# Altium schematic sheet LNA_6_GHz.SchDoc
size A; SheetNumber: 1; SheetTotal: 11
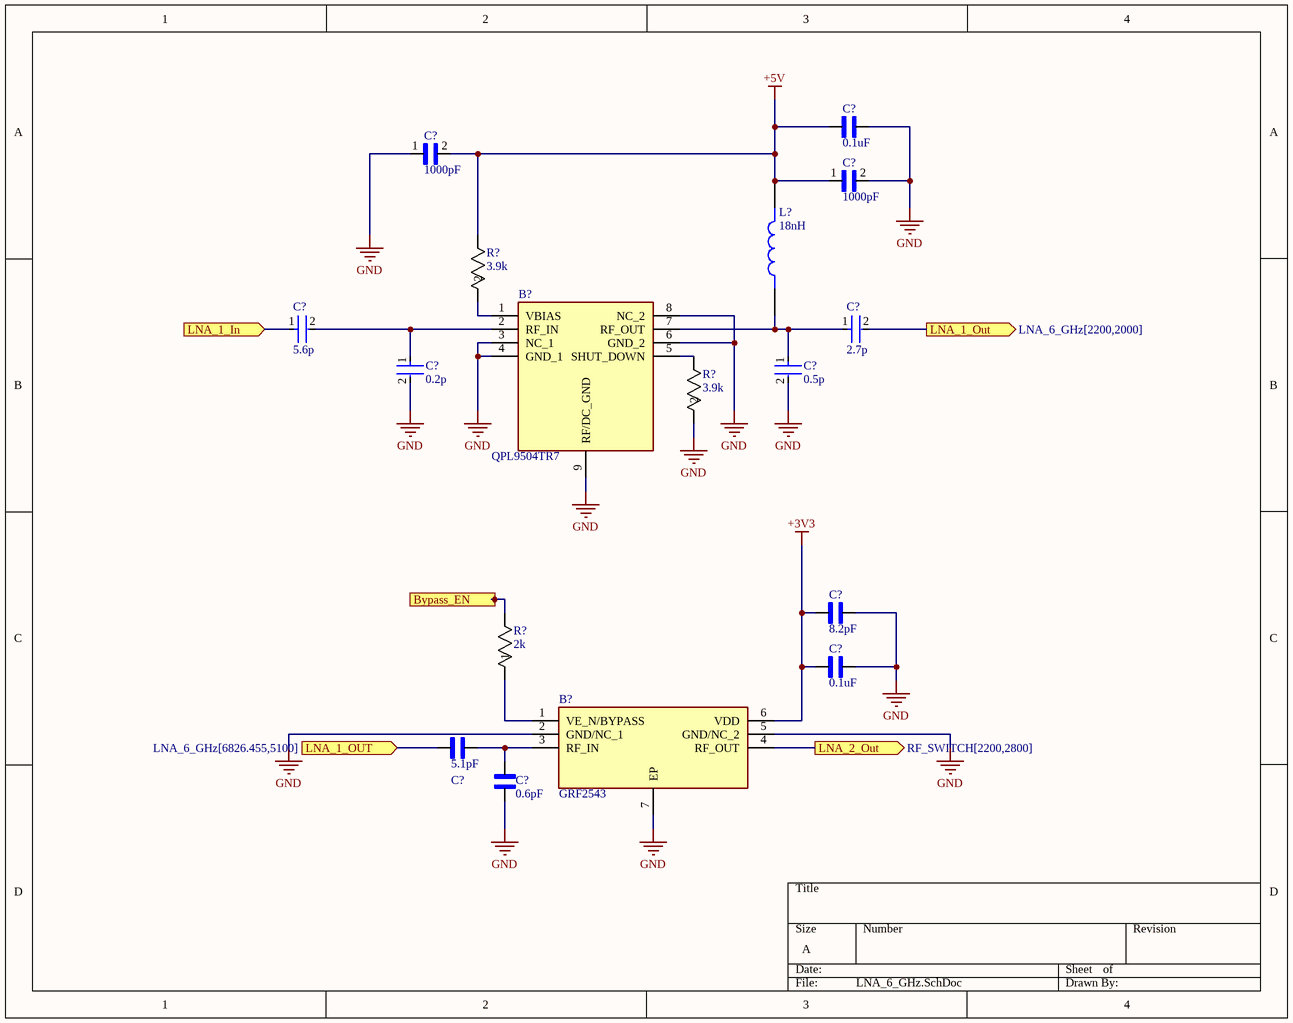
[diagram p0: LNA_6_GHz.SchDoc]

## Parts
(Parts that share a designator on the sheet are numbered #1, #2 ... from top to bottom, then left to right.)
B?#1  QPL9504TR7  [SON50P200X200X90-9N-D]
B?#2  GRF2543  [SON50P150X150X45-7N]
C?#1  0.1uF  [CAPC1005X55N]
C?#2  1000pF  [CAPC1005X55N]
C?#3  1000pF  [CAPC1005X55N]
C?#4  5.6p  [FP-GJM155-0_05-IPC_A]
C?#5  2.7p  [FP-GJM155-0_05-IPC_A]
C?#6  0.2p  [FP-GJM155-0_05-IPC_A]
C?#7  0.5p  [FP-GJM155-0_05-IPC_A]
C?#8  8.2pF  [CAPC0603X33N]
C?#9  0.1uF  [CAPC1005X55N]
C?#10  5.1pF  [CAPC0603X33N]
C?#11  0.6pF  [CAPC0603X33N]
L?  18nH  [IND_0603CS-18NXJRW]
R?#1  3.9k  [RES0402_CRG_TYCO_TYC-M]
R?#2  3.9k  [RES0402_CRG_TYCO_TYC-M]
R?#3  2k  [RES_RC0201_P6XP3_YAG]

## Ports
Bypass_EN (in), LNA_1_In (in), LNA_1_OUT (in, see LNA_6_GHz[6826.455,5100]), LNA_1_Out (out, see LNA_6_GHz[2200,2000]), LNA_2_Out (out, see RF_SWITCH[2200,2800])

## Nets
+3V3: B?#2.6(VDD) C?#8.1 C?#9.1
+5V: C?#1.1 C?#2.2 C?#3.1 L?.2 R?#1.1
GND: B?#1.3(NC_1) B?#1.4(GND_1) B?#1.6(GND_2) B?#1.8(NC_2) B?#1.9(RF/DC_GND) B?#2.2(GND/NC_1) B?#2.5(GND/NC_2) B?#2.7(EP) C?#1.2 C?#2.1 C?#3.2 C?#6.2 C?#7.2 C?#8.2 C?#9.2 C?#11.1 R?#2.2
Bypass_EN: R?#3.2 ; port Bypass_EN
LNA_1_In: C?#4.1 ; port LNA_1_In
LNA_1_Out: C?#5.2 C?#10.1 ; port LNA_1_Out, port LNA_1_OUT
LNA_2_Out: B?#2.4(RF_OUT) ; port LNA_2_Out
NetB?#1_1: B?#1.1(VBIAS) R?#1.2
NetB?#1_2: B?#1.2(RF_IN) C?#4.2 C?#6.1
NetB?#1_5: B?#1.5(SHUT_DOWN) R?#2.1
NetB?#1_7: B?#1.7(RF_OUT) C?#5.1 C?#7.1 L?.1
NetB?#2_1: B?#2.1(VE_N/BYPASS) R?#3.1
NetB?#2_3: B?#2.3(RF_IN) C?#10.2 C?#11.2

## Library data of the parts
B?#1 = QPL9504TR7: Ultra Low Noise, Flat Gain LNA; Manufacturer_Name: Qorvo; Geometry.Height: 0.9mm; Manufacturer_Part_Number: QPL9504TR7; Mouser Part Number: 772-QPL9504TR7; Mouser Price/Stock: https://www.mouser.co.uk/ProductDetail/Qorvo/QPL9504TR7?qs=iLbezkQI%252BsiSWi8SJWi3jA%3D%3D; Arrow Part Number: *; Arrow Price/Stock: *; Datasheet Link: https://www.qorvo.com/products/d/da007934; Supplier: Avnet; Supplier Part Number: GJM1555C1H5R6CB01D
B?#2 = GRF2543: RF Amplifier High Gain, LNA with Bypass; IEEE 802.11 a/n/ac/p, 4.9 - 6.0 GHz; Manufacturer_Name: Guerrilla RF; Geometry.Height: 0.45mm; Mouser Part Number: 459-GRF2543; Mouser Price/Stock: https://www.mouser.co.uk/ProductDetail/Guerrilla-RF/GRF2543?qs=PqoDHHvF64%2FihZz%2FtUpOTQ%3D%3D; Manufacturer_Part_Number: GRF2543; Datasheet Link: https://www.guerrilla-rf.com/products/DataSheet?sku=2543&file_name=GRF2543DS.pdf
C?#1 = GRM155R61A104KA01J: 0402 0.1 uF 10 V Â±10% Tolerance X5R SMT Multilayer Ceramic Capacitor; MF: Murata Electronics; SnapEDA_Link: https://www.snapeda.com/parts/GRM155R61A104KA01J/Murata+Electronics+North+America/view-part/?ref=snap; Package: 1005-2 Murata; Value: *; MP: GRM155R61A104KA01J; Check_prices: https://www.snapeda.com/parts/GRM155R61A104KA01J/Murata+Electronics+North+America/view-part/?ref=eda
C?#2 C?#3 = C1005X7R1H102K050BA: 1000 pF Â±10% 50V Ceramic Capacitor X7R 0402 (1005 Metric); MF: TDK; Purchase-URL: https://pricing.snapeda.com/search/part/C1005X7R1H102K050BA/?ref=eda; Package: 1005 TDK; MP: C1005X7R1H102K050BA; Digi-Key_Part_Number: 445-1256-2-ND; Value: *; Check_prices: https://www.snapeda.com/parts/C1005X7R1H102K050BA/TDK/view-part/?ref=eda; SnapEDA_Link: https://www.snapeda.com/parts/C1005X7R1H102K050BA/TDK/view-part/?ref=snap
C?#4 = CMP-2008-03866-2-5.6p: Multi-Layer Ceramic Capacitor 5.6pF C0G  ±0.25pF 0402 Paper T/R; Voltage Rating: 50V; Lead Free: Lead Free; Radiation Hardening: No; Termination: SMD/SMT; Width: 0.02inch; Capacitance: 5.6pF; Thickness: 0.022inch; Depth: 0.5mm; Max Operating Temperature: 125°C; Package Quantity: 1; Case Code (Imperial): 0402; Case Code (Metric): 1005; Mount: Surface Mount; Voltage: 50V; Packaging: Tape and Reel; Length: 1mm; Voltage Rating (DC): 50V; Case/Package: 0402; Dielectric: C0G; Min Operating Temperature: -55°C; Height: 0.5mm
C?#5 = CMP-2008-03841-2-2.7p: Multi-Layer Ceramic Capacitor 2.7pF C0G  ±0.25pF 0402 Paper T/R; Voltage: 50V; Insulation Resistance: 10GR; Lead Free: Lead Free; Case Code (Metric): 1005; Min Operating Temperature: -55°C; Case Code (Imperial): 0402; Max Operating Temperature: 125°C; Thickness: 0.022inch; Voltage Rating (DC): 50V; Package Quantity: 1; Termination: SMD/SMT; Dielectric: C0G; Case/Package: 0402; Length: 1mm; Mount: Surface Mount; Height: 0.5mm; Voltage Rating: 50V; Radiation Hardening: No; Width: 0.02inch; Depth: 0.5mm; Packaging: Tape and Reel; Capacitance: 2.7pF
C?#6 = CMP-2008-03898-2-0.2p: Multi-Layer Ceramic Capacitor 0.2pF C0G  ±0.1pF 0402 Paper T/R; Voltage Rating (DC): 50V; Packaging: Tape and Reel; REACH SVHC: No SVHC; Mount: Surface Mount; Thickness: 0.022inch; Height: 0.5mm; Package Quantity: 1; Depth: 0.5mm; Max Operating Temperature: 125°C; Case Code (Imperial): 0402; Number of Pins: 2; Termination: SMD/SMT; Min Operating Temperature: -55°C; Lead Pitch: 0.3mm; Width: 0.5mm; Radiation Hardening: No; Length: 1mm; Voltage Rating: 50V; Dielectric: C0G; Case/Package: 0402; Capacitance: 0.2pF; Lead Free: Lead Free; Case Code (Metric): 1005
C?#7 = CMP-2008-03904-2-0.5p: Multi-Layer Ceramic Capacitor 0.5pF C0G  ±0.1pF 0402 Paper T/R; Voltage Rating (DC): 50V; Temperature Coefficient: 30ppm/°C; Lead Pitch: 0.3mm; Max Operating Temperature: 125°C; Thickness: 0.022inch; Termination: SMD/SMT; Depth: 0.5mm; Height: 0.5mm; Voltage Rating: 50V; Length: 1mm; Case/Package: 0402; Radiation Hardening: No; Min Operating Temperature: -55°C; Width: 0.02inch; Voltage: 50V; Number of Pins: 2; REACH SVHC: No SVHC; Case Code (Imperial): 0402; Package Quantity: 1; Mount: Surface Mount; Capacitance: 0.5pF; Dielectric: C0G; Lead Free: Lead Free; Case Code (Metric): 1005; Packaging: Tape and Reel
C?#8 = GJM0335C1H8R2BB01D-8.2p: SMD capacitor C0G(EIA) with capacitance 8.2pF Tol.0.1pF. Rated voltage 50Vdc 125C; MF: Murata Electronics; SnapEDA_Link: https://www.snapeda.com/parts/GJM0335C1H8R2BB01D/Murata/view-part/?ref=snap; Package: 0603 Taiyo Yuden; Value: *; MP: GJM0335C1H8R2BB01D; Check_prices: https://www.snapeda.com/parts/GJM0335C1H8R2BB01D/Murata/view-part/?ref=eda
C?#9 = GRM155R61A104KA01J-0.1u: 0402 0.1 uF 10 V Â±10% Tolerance X5R SMT Multilayer Ceramic Capacitor; MF: Murata Electronics; SnapEDA_Link: https://www.snapeda.com/parts/GRM155R61A104KA01J/Murata+Electronics+North+America/view-part/?ref=snap; Package: 1005-2 Murata; Value: *; MP: GRM155R61A104KA01J; Check_prices: https://www.snapeda.com/parts/GRM155R61A104KA01J/Murata+Electronics+North+America/view-part/?ref=eda
C?#10 = GJM0335C1H5R1WB01D-5.1p: SMD capacitor C0G(EIA) with capacitance 5.1pF Tol.0.05pF. Rated voltage 50Vdc 125C; MF: Murata; SnapEDA_Link: https://www.snapeda.com/parts/GJM0335C1H5R1WB01D/Murata/view-part/?ref=snap; Package: 0603 Taiyo Yuden; Value: *; MP: GJM0335C1H5R1WB01D; Check_prices: https://www.snapeda.com/parts/GJM0335C1H5R1WB01D/Murata/view-part/?ref=eda
C?#11 = GJM0335C1HR60WB01D-0.6p: SMD capacitor C0G(EIA) with capacitance 0.60pF Tol.0.05pF. Rated voltage 50Vdc 125C; MF: Murata; SnapEDA_Link: https://www.snapeda.com/parts/GJM0335C1HR60WB01D/Murata/view-part/?ref=snap; Package: 0603 Taiyo Yuden; Value: *; MP: GJM0335C1HR60WB01D; Check_prices: https://www.snapeda.com/parts/GJM0335C1HR60WB01D/Murata/view-part/?ref=eda
L? = 0603CS-18NXJRW: Package: None; Price: None; Value: *; MP: 0603CS-18NXJRW; Availability: Unavailable
R?#1 R?#2 = CRG0402F3K9: CRG0402 1% 3K9; Manufacturer_Name: TE Connectivity; Copyright: Copyright (C) 2026 Ultra Librarian. All rights reserved.; Manufacturer_Part_Number: CRG0402F3K9
R?#3 = RC0201JR-072KL: No Description Available; Manufacturer_Name: Yageo; Copyright: Copyright (C) 2026 Ultra Librarian. All rights reserved.; Manufacturer_Part_Number: RC0201JR-072KL